# EasyEDA Pro project fei1554973967-sw3538-dff8db20.epro, schematic 显示核心板_1
Board Name: 显示板_1; Create Date: 2025-04-19; Page Name: P1; Project Name: SW3538彩屏桌面充电器站; Schematic Name: 显示核心板_1; Update Date: 2025-06-20; Company: 嘉立创EDA; Page Size: A4; Version: V1.0
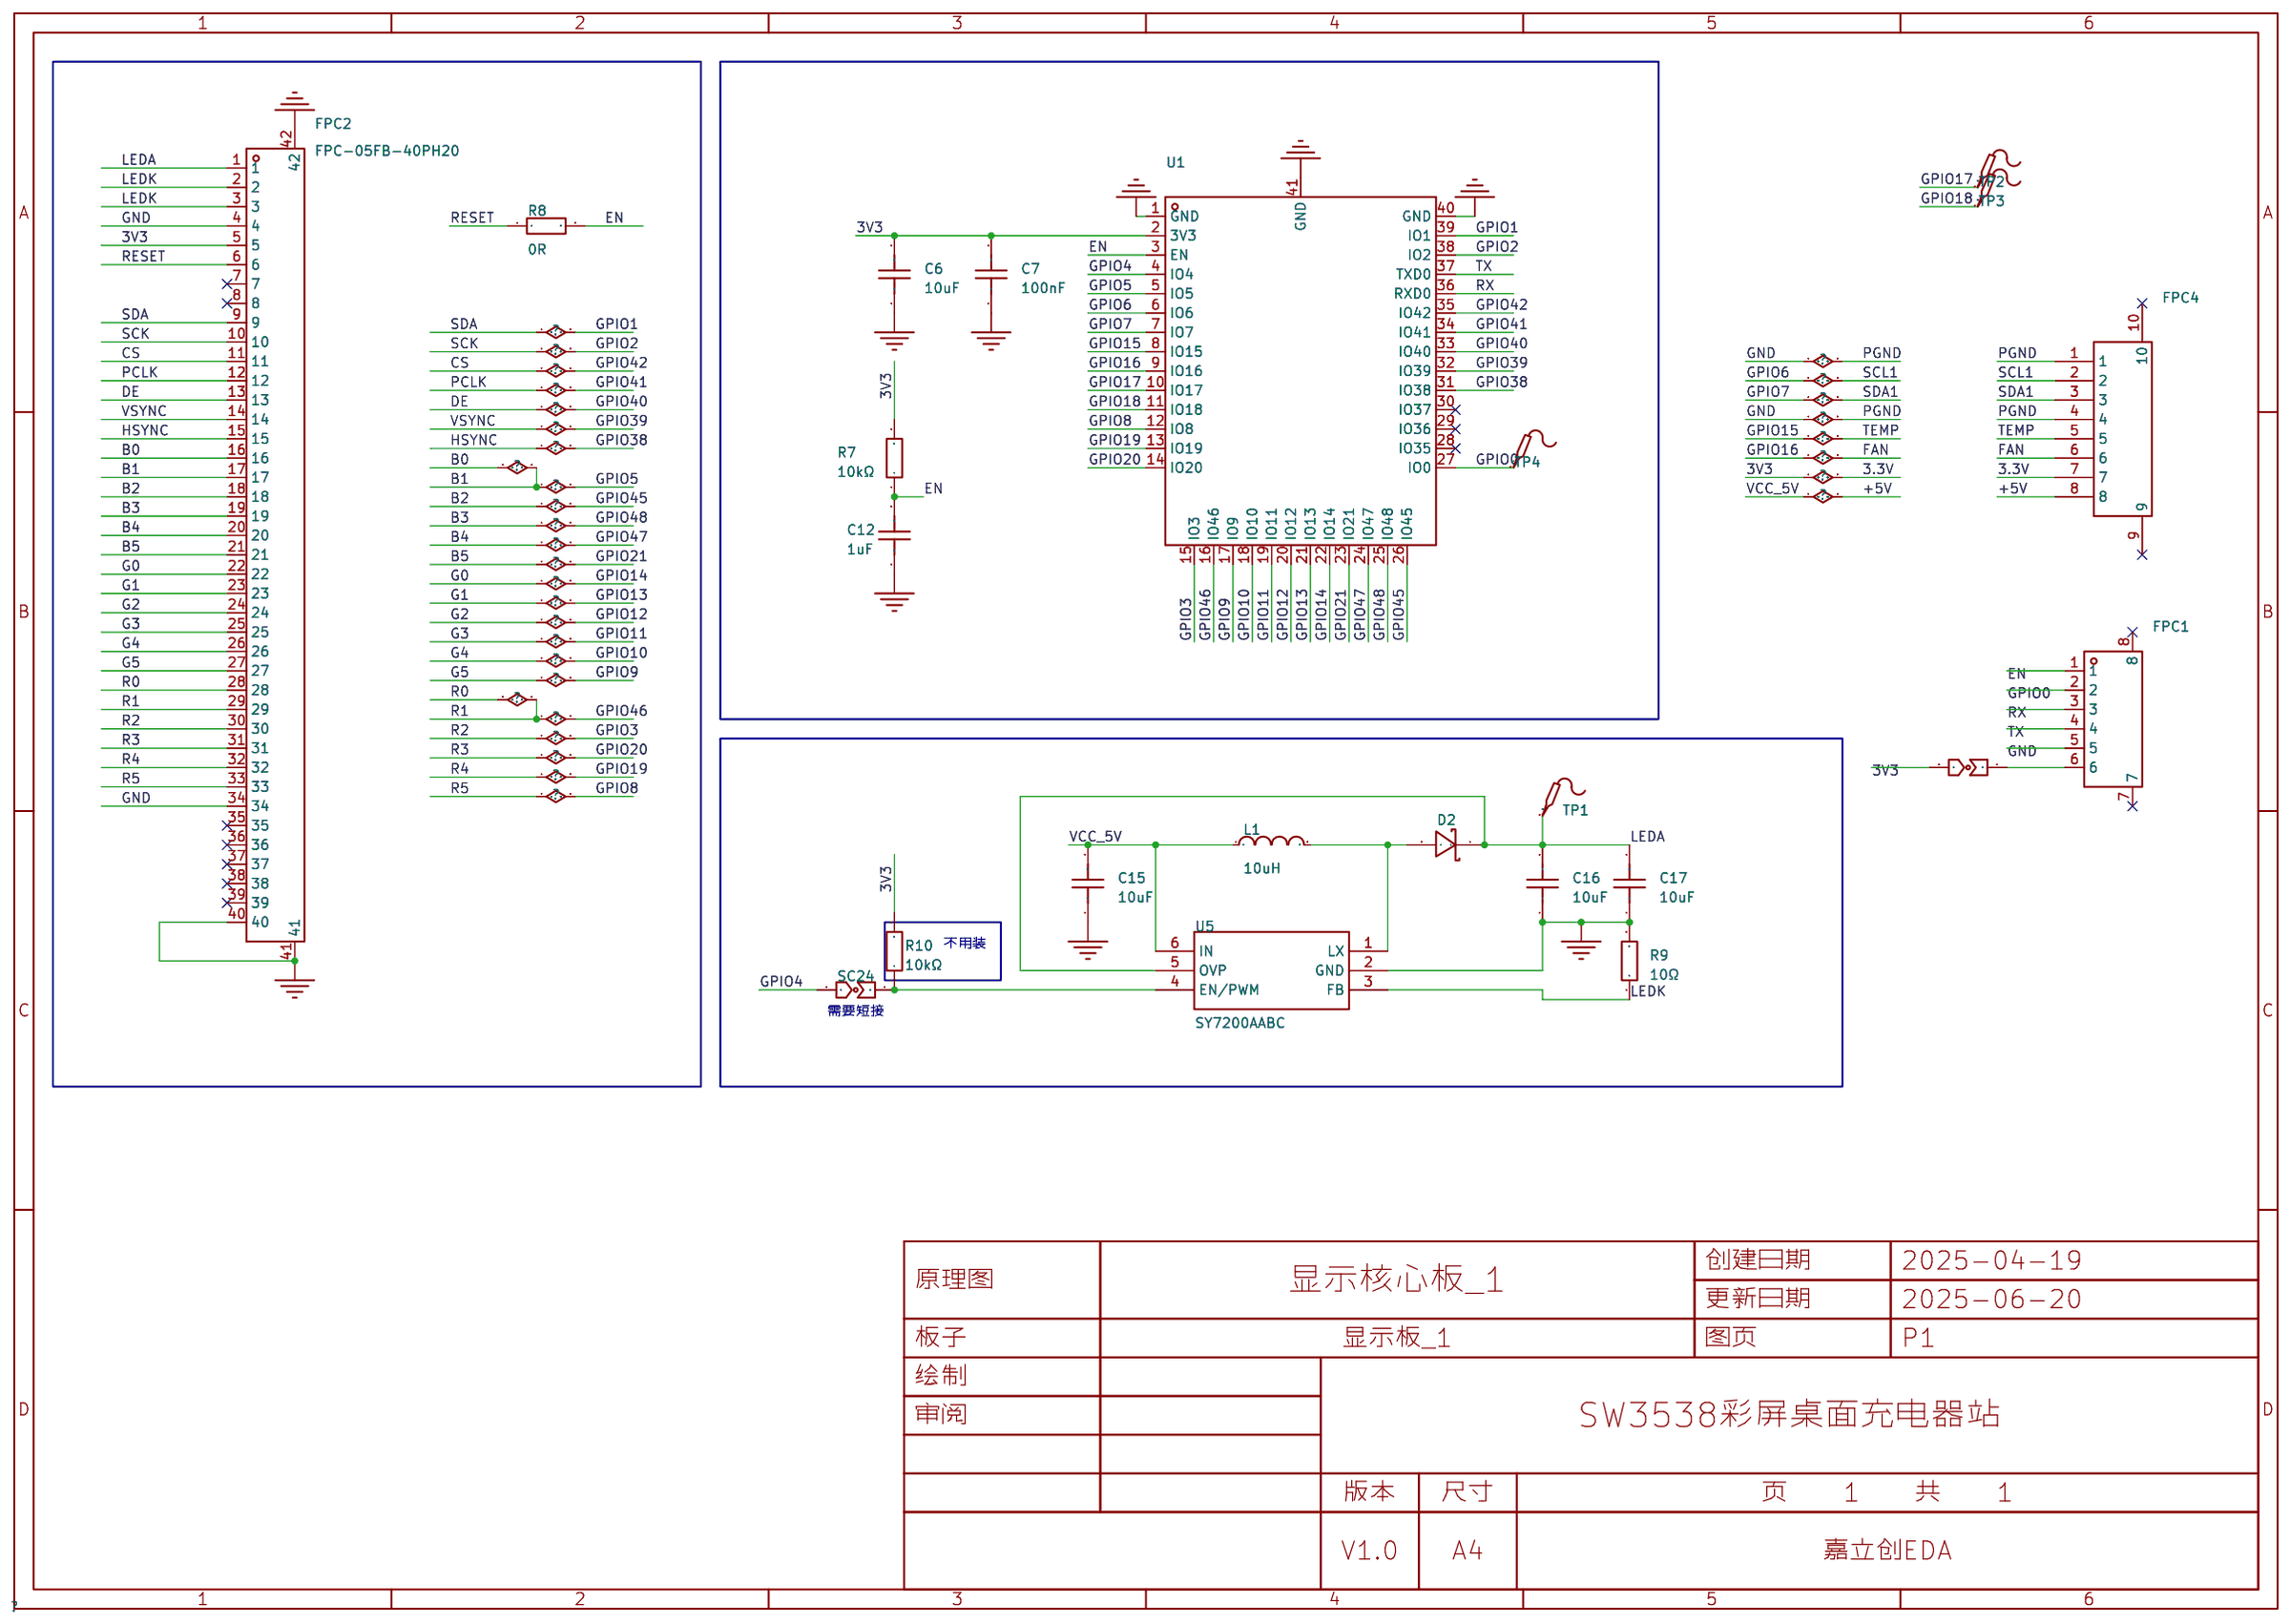
[diagram p2: schematic sheet]

## Parts
C6  10uF  [C0603]
C7  100nF  [C0603]
C12  1uF  [C0603]
C15  10uF  [C0603]
C16  10uF  [C0603]
C17  10uF  [C0603]
D2  1N5819WS  [SOD-323_L1.8-W1.3-LS2.5-RD]
FPC1  0.5-6PQFHY-H1.0 119  [FPC-SMD_6P-P0.50_SHOU-HAN_0.5-6PQFHY-H1.0]
FPC2  FPC-05FB-40PH20  [FPC-SMD_40P-P0.50_XUNPU_FPC-05FB-40PH20]
FPC4  AFA07-S08FCA-00  [FPC-SMD_8P-P1.00_LCS-XJ]
L1  10uH  [IND-SMD_L2.0-W2.0]
R7  10kΩ  [R0603]
R8  0R  [R0603]
R9  10Ω  [R0603]
R10  10kΩ  [R0603]
SC24  -  [短接点0402]
SC30  -  [短接点0402]
TP1  -  [Test-Point-0.5mm]
TP2  -  [Test-Point-0.5mm]
TP3  -  [Test-Point-0.5mm]
TP4  -  [Test-Point-0.5mm]
U1  ESP32-S3-WROOM-1-N16R8  [WIRELM-SMD_ESP32-S3-WROOM-1]
U5  SY7200AABC  [SOT-23-6_L2.9-W1.6-P0.95-LS2.8-BR]

## Library data of the parts
C6 C15-C17 = CGA0603X5R106K100JT: 容值:10uF;精度:±10%;额定电压:10V;温度系数:X5R;; LCSC Part Name: 10uF ±10% 10V; Supplier Part: C6119842; Manufacturer: HRE(芯声); Supplier Footprint: 0603; JLCPCB Part Class: 扩展库; Supplier: LCSC; Tolerance: ±10%; Voltage Rating: 10V; Temperature Coefficient: X5R; Voltage Rated: 10V
C7 = CGA0603X7R104K500JT: 容值:100nF;精度:±10%;额定电压:50V;温度系数:X7R;; LCSC Part Name: 100nF ±10% 50V; Supplier Part: C6119867; Manufacturer: HRE(芯声); Supplier Footprint: 0603; JLCPCB Part Class: 扩展库; Datasheet: https://atta.szlcsc.com/upload/public/pdf/source/20250103/C44077DA9E7B3EFAE02F22B6D3D1CBC9.pdf; Supplier: LCSC; Tolerance: ±10%; Voltage Rating: 50V; Temperature Coefficient: X7R; Voltage Rated: 50V
C12 = CGA0603X5R105K500JT: 容值:1uF;精度:±10%;额定电压:50V;材质(温度系数):X5R;; LCSC Part Name: 1uF ±10% 50V; Supplier Part: C6119852; Manufacturer: HRE(芯声); Supplier Footprint: 0603; JLCPCB Part Class: 扩展库; Supplier: LCSC; Tolerance: ±10%; Voltage Rated: 50V; Temperature Coefficient: X5R
D2 = 1N5819WS_C191023: 正向压降(Vf):600mV@1A;直流反向耐压(Vr):40V;整流电流:1A;; LCSC Part Name: 电压:40V 电流:1A; Supplier Part: C191023; Manufacturer: Hottech(合科泰); Supplier Footprint: SOD-323; JLCPCB Part Class: 基础库; Datasheet: https://atta.szlcsc.com/upload/public/pdf/source/20220428/3CB86FD8D28D653594B4E35F9D5AEFD9.pdf; Supplier: LCSC; Forward Voltage (Vf@If): 600mV@1A; Reverse Voltage (Vr): 40V; Rectified Current: 1A
FPC1 = 0.5-6PQFHY-H1.0 119: 锁定特性:翻盖式;触点类型:双侧触点上下接;触点数量:6P;间距:0.5mm;安装类型:卧贴;工作温度范围:-55℃~+85℃;; LCSC Part Name: 翻盖式 双侧触点上下接 P数:6P 间距:0.5mm; Supplier Part: C2858296; Manufacturer: SHOU HAN(首韩); Supplier Footprint: SMD,P=0.5mm,卧贴; JLCPCB Part Class: 扩展库; Supplier: LCSC; Locking Feature: 翻盖式; Contact Type: 双侧触点上下接; Number of Contacts: 6P; Pitch: 0.5mm; Mounting Type: 卧贴; FFC, FCB Thickness: 0.3mm; Height Above Board: 1mm; Contact Material: 磷青铜; Contact Plating: 金; Operating Temperature Range: -55℃~+85℃
FPC2 = FPC-05FB-40PH20: 锁定特性:翻盖式;触点类型:双侧触点/上下接;触点数量:40P;间距:0.5mm;安装类型:卧贴;工作温度范围:-25℃~+85℃;; LCSC Part Name: 间距:0.5mm P数:40P 翻盖式 双侧触点/上下接; Supplier Part: C2856837; Manufacturer: XUNPU(讯普); Supplier Footprint: SMD,P=0.5mm,卧贴; JLCPCB Part Class: 扩展库; Datasheet: https://atta.szlcsc.com/upload/public/pdf/source/20210922/C2856837_A0FF02895414764A7F2E525E58748FC4.pdf; Supplier: LCSC; Locking Feature: 翻盖式; Contact Type: 双侧触点/上下接; Number of Contacts: 40P; Pitch: 0.5mm; Mounting Type: 卧贴; FFC, FCB Thickness: 0.3mm; Height Above Board: 2mm; Operating Temperature Range: -25℃~+85℃
FPC4 = AFA07-S08FCA-00: 锁定特性:抽屉式;触点类型:下接;触点数量:8P;间距:1mm;安装类型:卧贴;; LCSC Part Name: 间距:1mm P数:8P 抽屉式 下接; Supplier Part: C262714; Manufacturer: JS(钜硕电子); Supplier Footprint: SMD,P=1mm,卧贴; JLCPCB Part Class: 扩展库; Datasheet: https://atta.szlcsc.com/upload/public/pdf/source/20191217/C262716_30B15E9A77BFCA4A54741C92DB3BE8CC.pdf; Supplier: LCSC; Locking Feature: 抽屉式; Contact Type: 下接; Number of Contacts: 8P; Pitch: 1mm; Mounting Type: 卧贴; FFC, FCB Thickness: 0.3mm; Height Above Board: 2.5mm
L1 = SPH202012H100MT: 电感值:10uH;精度:±20%;额定电流:490mA;饱和电流(Isat):720mA;类型:-;; LCSC Part Name: 10uH ±20% 720mA; Supplier Part: C383082; Manufacturer: Sunlord(顺络); Supplier Footprint: SMD,2x2mm; JLCPCB Part Class: 扩展库; Datasheet: https://atta.szlcsc.com/upload/public/pdf/source/20231024/91C3B1E68892D3DB9D2F9A4F7057A096.pdf; Supplier: LCSC; Tolerance: ±20%; Rated Current: 490mA; Current - Saturation(Isat): 720mA; DC Resistance(DCR): 654mΩ
R7 R10 = 0603WAF1002T5E: 电阻类型:厚膜电阻;阻值:10kΩ;精度:±1%;功率:100mW;最大工作电压:75V;温度系数:±100ppm/℃;; LCSC Part Name: 厚膜电阻 10kΩ ±1% 100mW; Supplier Part: C25804; Manufacturer: UNI-ROYAL(厚声); Supplier Footprint: 0603; JLCPCB Part Class: 基础库; Datasheet: https://atta.szlcsc.com/upload/public/pdf/source/20200306/C422600_1E6D84923E4A46A82E41ADD87F860B5C.pdf; Supplier: LCSC; Type: 厚膜电阻; Tolerance: ±1%; Power(Watts): 100mW; Overload Voltage (Max): 75V; Temperature Coefficient: ±100ppm/℃; Operating Temperature Range: -55℃~+155℃
R8 = Res_0603: Supplier Footprint: 0603
R9 = 0603WAF100JT5E: 电阻类型:厚膜电阻;阻值:10Ω;精度:±1%;功率:100mW;最大工作电压:75V;温度系数:±400ppm/℃;; LCSC Part Name: 10Ω ±1% 100mW 厚膜电阻; Supplier Part: C22859; Manufacturer: UNI-ROYAL(厚声); Supplier Footprint: 0603; JLCPCB Part Class: 基础库; Datasheet: https://atta.szlcsc.com/upload/public/pdf/source/20200306/C422600_1E6D84923E4A46A82E41ADD87F860B5C.pdf; Supplier: LCSC; Type: 厚膜电阻; Tolerance: ±1%; Power(Watts): 100mW; Overload Voltage (Max): 75V; Temperature Coefficient: ±400ppm/℃; Operating Temperature Range: -55℃~+155℃
SC24 SC30 = 短接点0402: 焊上就完事了
TP1-TP4 = Test-Point: Test Point 测试点
U1 = ESP32-S3-WROOM-1-N16R8: LCSC Part Name: 通用型Wi-Fi+低功耗蓝牙MCU模组; Supplier Part: C2913202; Manufacturer: ESPRESSIF(乐鑫); Supplier Footprint: SMD,18x25.5mm; JLCPCB Part Class: Extended Part; Datasheet: https://atta.szlcsc.com/upload/public/pdf/source/20241030/6A412B13087E1327DF6279F5735253CA.pdf; Supplier: LCSC
U5 = SY7200AABC: 30V 2A LED驱动 升压 效率高达96% 软启动 LED开路保护; Supplier Part: C107309; Manufacturer: silergy(矽力杰); Supplier Footprint: SOT-23-6; JLCPCB Part Class: 扩展库; Datasheet: https://atta.szlcsc.com/upload/public/pdf/source/20170925/C107309_1506321334417990079.pdf; Supplier: LCSC

## Nets
3.3V: C6.2 C7.2 FPC2.5 FPC4.7 R7.2 R10.2 SC30.2 U1.2(3V3)
+5V: C15.2 FPC4.8 L1.1 U5.6(IN)
GND: C6.1 C7.1 C12.1 C15.1 C16.1 C17.1 FPC1.5 FPC2.4 FPC2.34 FPC2.40 FPC2.41 FPC2.42 FPC4.1 FPC4.4 R9.2 U1.1(GND) U1.40(GND) U1.41(GND) U5.2(GND)
B0: FPC2.16 FPC2.17 U1.5(IO5)
B2: FPC2.18 U1.26(IO45)
B3: FPC2.19 U1.25(IO48)
B4: FPC2.20 U1.24(IO47)
B5: FPC2.21 U1.23(IO21)
CS: FPC2.11 U1.35(IO42)
DE: FPC2.13 U1.33(IO40)
EN: C12.2 FPC1.1 R7.1 R8.2 U1.3(EN)
FAN: FPC4.6 U1.9(IO16)
G0: FPC2.22 U1.22(IO14)
G1: FPC2.23 U1.21(IO13)
G2: FPC2.24 U1.20(IO12)
G3: FPC2.25 U1.19(IO11)
G4: FPC2.26 U1.18(IO10)
G5: FPC2.27 U1.17(IO9)
GPIO0: FPC1.2 TP4.1 U1.27(IO0)
GPIO1: FPC2.9 U1.39(IO1)
GPIO2: FPC2.10 U1.38(IO2)
GPIO3: FPC2.30 U1.15(IO3)
GPIO4: SC24.2 U1.4(IO4)
GPIO6: FPC4.2 U1.6(IO6)
GPIO7: FPC4.3 U1.7(IO7)
GPIO8: FPC2.33 U1.12(IO8)
GPIO15: FPC4.5 U1.8(IO15)
GPIO17: TP2.1 U1.10(IO17)
GPIO18: TP3.1 U1.11(IO18)
GPIO19: FPC2.32 U1.13(IO19)
GPIO20: FPC2.31 U1.14(IO20)
GPIO38: FPC2.15 U1.31(IO38)
GPIO39: FPC2.14 U1.32(IO39)
GPIO41: FPC2.12 U1.34(IO41)
GPIO46: FPC2.28 FPC2.29 U1.16(IO46)
LEDA: C16.2 C17.2 D2.1(K) FPC2.1 TP1.1 U5.5(OVP)
LEDK: FPC2.2 FPC2.3 R9.1 U5.3(FB)
RESET: FPC2.6 R8.1
RX: FPC1.3 U1.36(RXD0)
TX: FPC1.4 U1.37(TXD0)
$1N2484: D2.2(A) L1.2 U5.1(LX)
$1N2494: R10.1 SC24.1 U5.4(EN/PWM)
$1N4031: FPC1.6 SC30.1

Not connected (* = marked no-connect by the designer): FPC1 7* 8*; FPC2 7* 8* 35* 36* 37* 38* 39*; FPC4 9* 10*; U1 28(IO35)* 29(IO36)* 30(IO37)*

## Notes on the sheet
- 不用装
- 需要短接
